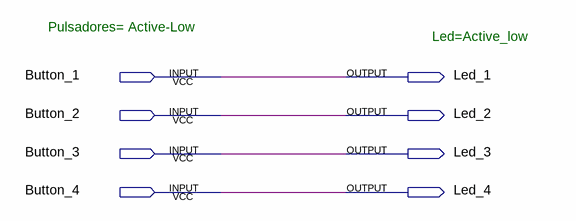
[diagram p0: schematic sheet]
// Quartus schematic Prueba_doc.bdf as structural Verilog: 0 symbols, 8 pins
module Prueba_doc (
  input  Button_1,
  input  Button_2,
  input  Button_3,
  input  Button_4,
  output Led_1,
  output Led_2,
  output Led_3,
  output Led_4
);


  assign Led_1 = Button_1;
  assign Led_2 = Button_2;
  assign Led_3 = Button_3;
  assign Led_4 = Button_4;

  // Notes on the sheet:
  //   Pulsadores= Active-Low
  //   Led=Active_low
endmodule
